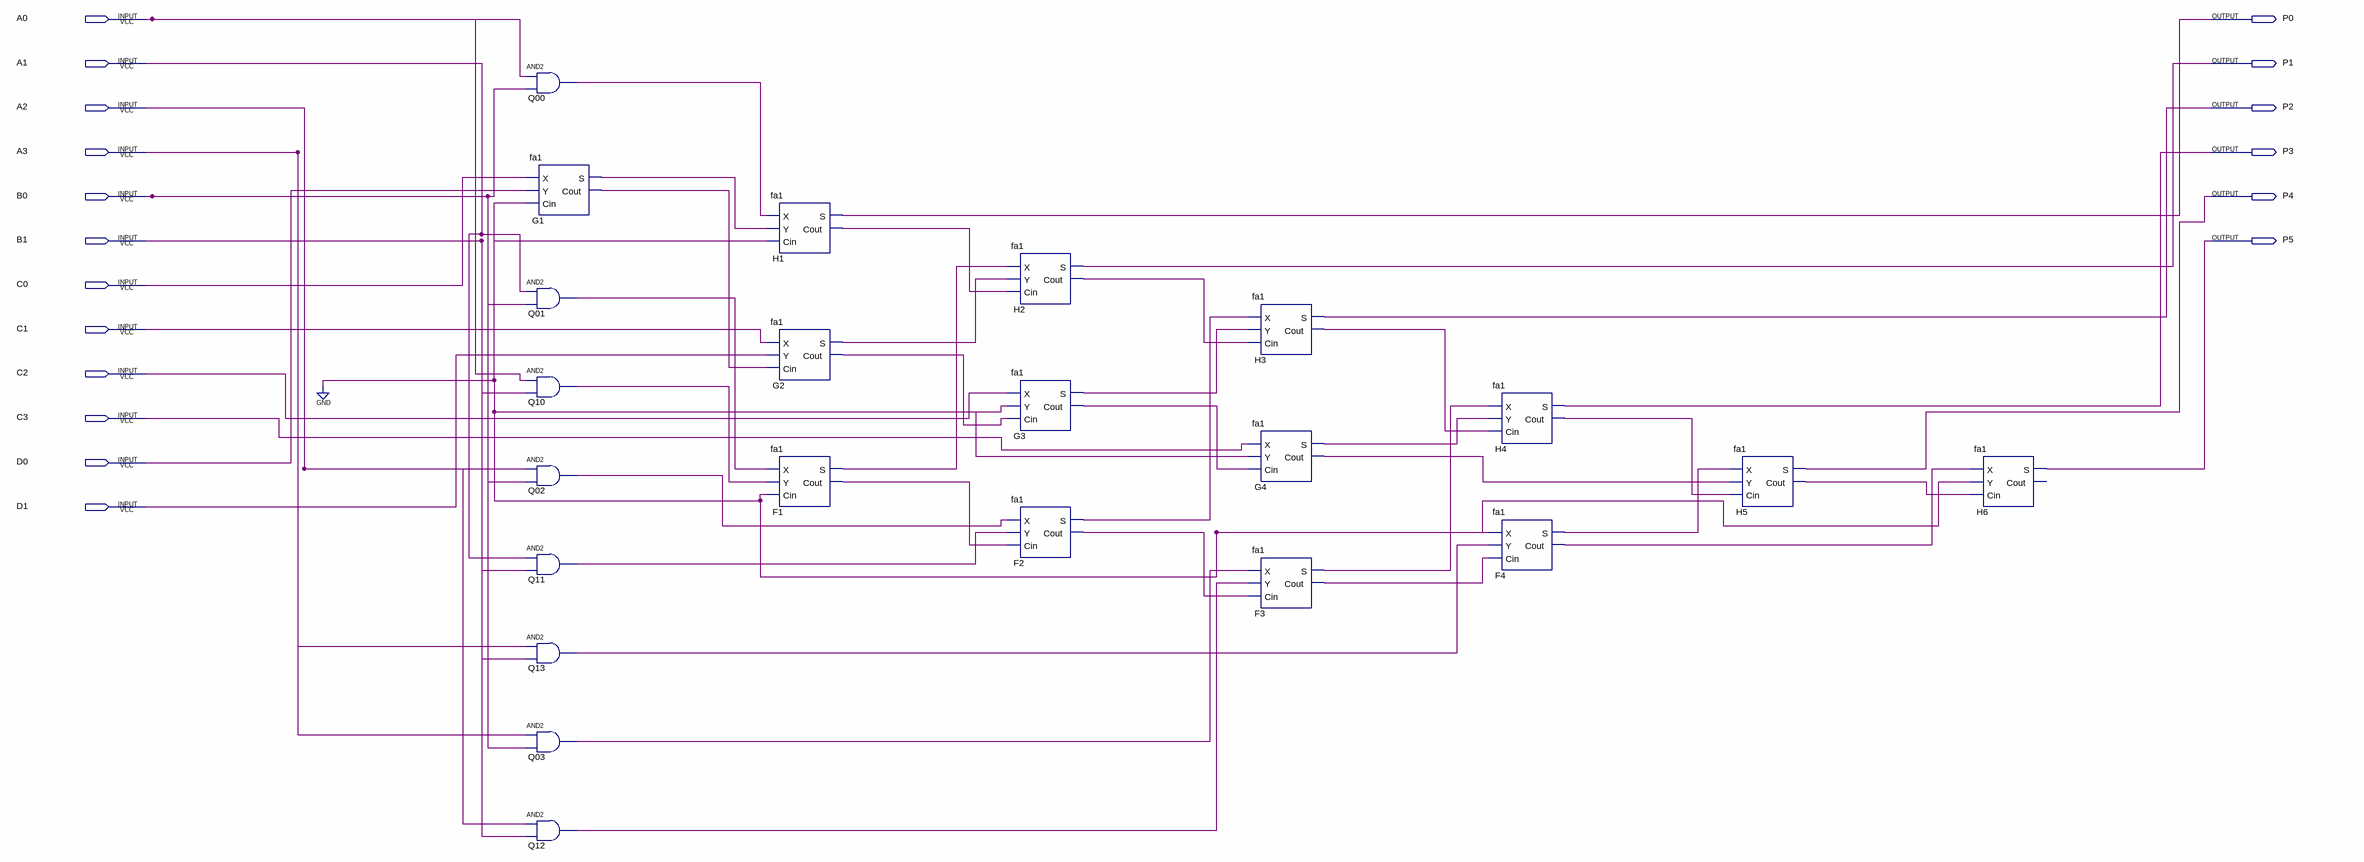
[diagram p0: schematic sheet]
// Quartus schematic mac42.bdf as structural Verilog: 22 symbols, 18 pins
module mac42 (
  input  A0,
  input  A1,
  input  A2,
  input  A3,
  input  B0,
  input  B1,
  input  C0,
  input  C1,
  input  C2,
  input  C3,
  input  D0,
  input  D1,
  output P0,
  output P1,
  output P2,
  output P3,
  output P4,
  output P5
);

  wire F1_cout, F1_s, F2_cout, F2_s, F3_cout, F3_s, F4_cout, F4_s, G1_cout, G1_s, G2_cout, G2_s, G3_cout,
       G3_s, G4_cout, G4_s, H1_cout, H2_cout, H3_cout, H4_cout, H5_cout, Q00_out, Q01_out, Q02_out, Q03_out,
       Q10_out, Q11_out, Q12_out, Q13_out;

  and Q00 (Q00_out, A0, B0);
  fa1 G1 (.X(C0), .Y(D0), .Cin(1'b0), .S(G1_s), .Cout(G1_cout));
  and Q01 (Q01_out, A1, B0);
  and Q10 (Q10_out, A0, B1);
  and Q02 (Q02_out, A2, B0);
  and Q11 (Q11_out, A1, B1);
  and Q13 (Q13_out, A3, B1);
  and Q03 (Q03_out, A3, B0);
  and Q12 (Q12_out, A2, B1);
  fa1 H1 (.X(Q00_out), .Y(G1_s), .Cin(1'b0), .S(P0), .Cout(H1_cout));
  fa1 G2 (.X(C1), .Y(D1), .Cin(G1_cout), .S(G2_s), .Cout(G2_cout));
  fa1 F1 (.X(Q01_out), .Y(Q10_out), .Cin(1'b0), .S(F1_s), .Cout(F1_cout));
  fa1 H2 (.X(F1_s), .Y(G2_s), .Cin(H1_cout), .S(P1), .Cout(H2_cout));
  fa1 G3 (.X(C2), .Y(1'b0), .Cin(G2_cout), .S(G3_s), .Cout(G3_cout));
  fa1 F2 (.X(Q02_out), .Y(Q11_out), .Cin(F1_cout), .S(F2_s), .Cout(F2_cout));
  fa1 H3 (.X(F2_s), .Y(G3_s), .Cin(H2_cout), .S(P2), .Cout(H3_cout));
  fa1 G4 (.X(C3), .Y(1'b0), .Cin(G3_cout), .S(G4_s), .Cout(G4_cout));
  fa1 F3 (.X(Q03_out), .Y(Q12_out), .Cin(F2_cout), .S(F3_s), .Cout(F3_cout));
  fa1 H4 (.X(F3_s), .Y(G4_s), .Cin(H3_cout), .S(P3), .Cout(H4_cout));
  fa1 F4 (.X(1'b0), .Y(Q13_out), .Cin(F3_cout), .S(F4_s), .Cout(F4_cout));
  fa1 H5 (.X(F4_s), .Y(G4_cout), .Cin(H4_cout), .S(P4), .Cout(H5_cout));
  fa1 H6 (.X(F4_cout), .Y(1'b0), .Cin(H5_cout), .S(P5));  // open: Cout
endmodule
